# Altium schematic sheet Top Sheet.SchDoc
size A4; DocumentNumber: 1; SheetNumber: 1; SheetTotal: 7
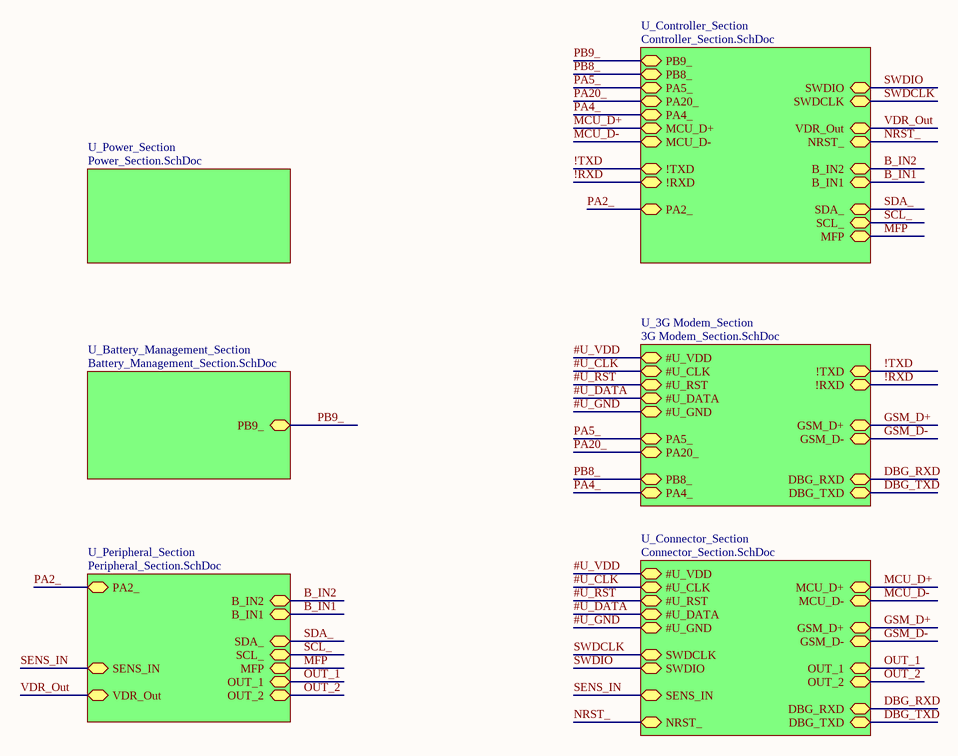
[diagram p0: Top Sheet.SchDoc]

## Sub-sheets
U_3G Modem_Section = 3G Modem_Section.SchDoc: #U_CLK (bidir), #U_RST (bidir), #U_DATA (bidir), GSM_D+ (bidir), #U_GND (bidir), PA5_ (bidir), PA20_ (bidir), #U_VDD (bidir), !TXD (bidir), !RXD (bidir), PB8_ (bidir), PA4_ (bidir), DBG_TXD (bidir), DBG_RXD (bidir), GSM_D- (bidir)
U_Battery_Management_Section = Battery_Management_Section.SchDoc: PB9_ (bidir)
U_Connector_Section = Connector_Section.SchDoc: #U_VDD (bidir), GSM_D+ (bidir), MCU_D+ (bidir), #U_GND (bidir), NRST_ (bidir), #U_CLK (bidir), SWDCLK (bidir), #U_DATA (bidir), GSM_D- (bidir), #U_RST (bidir), SWDIO (bidir), SENS_IN (bidir), OUT_1 (bidir), OUT_2 (bidir), DBG_TXD (bidir), DBG_RXD (bidir), MCU_D- (bidir)
U_Controller_Section = Controller_Section.SchDoc: PA20_ (bidir), SWDIO (bidir), PA5_ (bidir), MCU_D+ (bidir), NRST_ (bidir), MCU_D- (bidir), SWDCLK (bidir), PA2_ (bidir), B_IN2 (bidir), B_IN1 (bidir), !TXD (bidir), !RXD (bidir), SDA_ (bidir), SCL_ (bidir), VDR_Out (bidir), PB8_ (bidir), PA4_ (bidir), MFP (bidir), PB9_ (bidir)
U_Peripheral_Section = Peripheral_Section.SchDoc: PA2_ (bidir), B_IN2 (bidir), B_IN1 (bidir), SCL_ (bidir), SDA_ (bidir), VDR_Out (bidir), OUT_1 (bidir), SENS_IN (bidir), OUT_2 (bidir), MFP (bidir)
U_Power_Section = Power_Section.SchDoc: no entries

## Nets
!RXD: sheet U_Controller_Section/!RXD, sheet U_3G Modem_Section/!RXD
!TXD: sheet U_Controller_Section/!TXD, sheet U_3G Modem_Section/!TXD
#U_CLK: sheet U_3G Modem_Section/#U_CLK, sheet U_Connector_Section/#U_CLK
#U_DATA: sheet U_3G Modem_Section/#U_DATA, sheet U_Connector_Section/#U_DATA
#U_GND: sheet U_3G Modem_Section/#U_GND, sheet U_Connector_Section/#U_GND
#U_RST: sheet U_3G Modem_Section/#U_RST, sheet U_Connector_Section/#U_RST
#U_VDD: sheet U_3G Modem_Section/#U_VDD, sheet U_Connector_Section/#U_VDD
B_IN1: sheet U_Controller_Section/B_IN1, sheet U_Peripheral_Section/B_IN1
B_IN2: sheet U_Controller_Section/B_IN2, sheet U_Peripheral_Section/B_IN2
DBG_RXD: sheet U_3G Modem_Section/DBG_RXD, sheet U_Connector_Section/DBG_RXD
DBG_TXD: sheet U_3G Modem_Section/DBG_TXD, sheet U_Connector_Section/DBG_TXD
GSM_D+: sheet U_3G Modem_Section/GSM_D+, sheet U_Connector_Section/GSM_D+
GSM_D-: sheet U_3G Modem_Section/GSM_D-, sheet U_Connector_Section/GSM_D-
MCU_D+: sheet U_Controller_Section/MCU_D+, sheet U_Connector_Section/MCU_D+
MCU_D-: sheet U_Controller_Section/MCU_D-, sheet U_Connector_Section/MCU_D-
MFP: sheet U_Controller_Section/MFP, sheet U_Peripheral_Section/MFP
NRST_: sheet U_Controller_Section/NRST_, sheet U_Connector_Section/NRST_
OUT_1: sheet U_Peripheral_Section/OUT_1, sheet U_Connector_Section/OUT_1
OUT_2: sheet U_Peripheral_Section/OUT_2, sheet U_Connector_Section/OUT_2
PA2_: sheet U_Controller_Section/PA2_, sheet U_Peripheral_Section/PA2_
PA4_: sheet U_Controller_Section/PA4_, sheet U_3G Modem_Section/PA4_
PA5_: sheet U_Controller_Section/PA5_, sheet U_3G Modem_Section/PA5_
PA20_: sheet U_Controller_Section/PA20_, sheet U_3G Modem_Section/PA20_
PB8_: sheet U_Controller_Section/PB8_, sheet U_3G Modem_Section/PB8_
PB9_: sheet U_Battery_Management_Section/PB9_, sheet U_Controller_Section/PB9_
SCL_: sheet U_Controller_Section/SCL_, sheet U_Peripheral_Section/SCL_
SDA_: sheet U_Controller_Section/SDA_, sheet U_Peripheral_Section/SDA_
SENS_IN: sheet U_Peripheral_Section/SENS_IN, sheet U_Connector_Section/SENS_IN
SWDCLK: sheet U_Controller_Section/SWDCLK, sheet U_Connector_Section/SWDCLK
SWDIO: sheet U_Controller_Section/SWDIO, sheet U_Connector_Section/SWDIO
VDR_Out: sheet U_Controller_Section/VDR_Out, sheet U_Peripheral_Section/VDR_Out